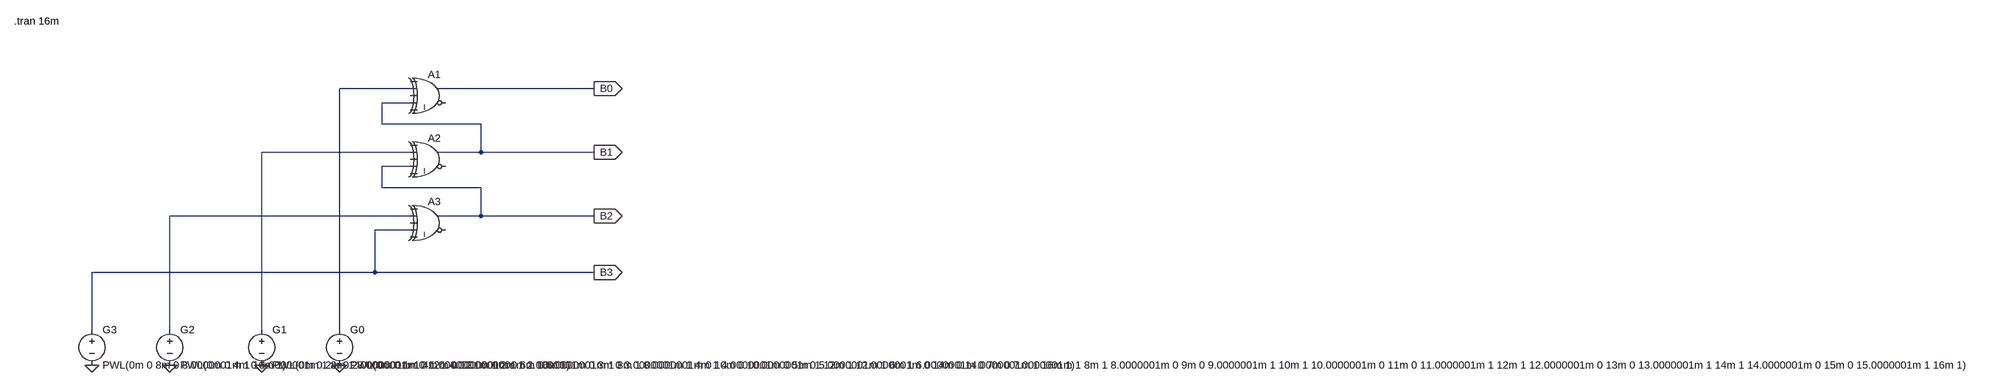
[diagram p0: schematic p42.asc]
p42.asc, the LTspice schematic file:
Version 4.1
SHEET 1 3620 680
WIRE -224 -144 -384 -144
WIRE 192 -144 -160 -144
WIRE -224 -112 -288 -112
WIRE -288 -64 -288 -112
WIRE -64 -64 -288 -64
WIRE -224 0 -560 0
WIRE -64 0 -64 -64
WIRE -64 0 -160 0
WIRE 192 0 -64 0
WIRE -224 32 -288 32
WIRE -288 80 -288 32
WIRE -64 80 -288 80
WIRE -224 144 -768 144
WIRE -64 144 -64 80
WIRE -64 144 -160 144
WIRE 192 144 -64 144
WIRE -224 176 -304 176
WIRE -304 272 -304 176
WIRE -304 272 -944 272
WIRE 192 272 -304 272
WIRE -944 528 -944 272
WIRE -768 528 -768 144
WIRE -560 528 -560 0
WIRE -384 528 -384 -144
FLAG -768 608 0
FLAG -560 608 0
FLAG -384 608 0
FLAG -944 608 0
FLAG 192 272 B3
IOPIN 192 272 Out
FLAG 192 144 B2
IOPIN 192 144 Out
FLAG 192 0 B1
IOPIN 192 0 Out
FLAG 192 -144 B0
IOPIN 192 -144 Out
SYMBOL voltage -944 512 R0
WINDOW 123 0 0 Left 0
WINDOW 39 0 0 Left 0
SYMATTR InstName G3
SYMATTR Value PWL(0m 0 8m 0 8.0000001m 1 16m 1)
SYMBOL voltage -768 512 R0
WINDOW 123 0 0 Left 0
WINDOW 39 0 0 Left 0
SYMATTR InstName G2
SYMATTR Value PWL(0m 0 4m 0 4.0000001m 1 8m 1 8.0000001m 0 12m 0 12.0000001m 1 16m 1)
SYMBOL voltage -560 512 R0
WINDOW 123 0 0 Left 0
WINDOW 39 0 0 Left 0
SYMATTR InstName G1
SYMATTR Value PWL(0m 0 2m 0 2.0000001m 1 4m 1 4.0000001m 0 6m 0 6.0000001m 1 8m 1 8.0000001m 0 10m 0 10.0000001m 1 12m 1 12.0000001m 0 14m 0 14.0000001m 1 16m 1)
SYMBOL voltage -384 512 R0
WINDOW 123 0 0 Left 0
WINDOW 39 0 0 Left 0
SYMATTR InstName G0
SYMATTR Value PWL(0m 0 1m 0 1.0000001m 1 2m 1 2.0000001m 0 3m 0 3.0000001m 1 4m 1 4.0000001m 0 5m 0 5.0000001m 1 6m 1 6.0000001m 0 7m 0 7.0000001m 1 8m 1 8.0000001m 0 9m 0 9.0000001m 1 10m 1 10.0000001m 0 11m 0 11.0000001m 1 12m 1 12.0000001m 0 13m 0 13.0000001m 1 14m 1 14.0000001m 0 15m 0 15.0000001m 1 16m 1)
SYMBOL Digital\\xor -176 -192 R0
SYMATTR InstName A1
SYMBOL Digital\\xor -176 -48 R0
SYMATTR InstName A2
SYMBOL Digital\\xor -176 96 R0
SYMATTR InstName A3
TEXT -1120 -352 Left 2 !.tran 16m

The netlist it stands for:
* p42.asc
V§G3 B3 0 PWL(0m 0 8m 0 8.0000001m 1 16m 1)
V§G2 N003 0 PWL(0m 0 4m 0 4.0000001m 1 8m 1 8.0000001m 0 12m 0 12.0000001m 1 16m 1)
V§G1 N002 0 PWL(0m 0 2m 0 2.0000001m 1 4m 1 4.0000001m 0 6m 0 6.0000001m 1 8m 1 8.0000001m 0 10m 0 10.0000001m 1 12m 1 12.0000001m 0 14m 0 14.0000001m 1 16m 1)
V§G0 N001 0 PWL(0m 0 1m 0 1.0000001m 1 2m 1 2.0000001m 0 3m 0 3.0000001m 1 4m 1 4.0000001m 0 5m 0 5.0000001m 1 6m 1 6.0000001m 0 7m 0 7.0000001m 1 8m 1 8.0000001m 0 9m 0 9.0000001m 1 10m 1 10.0000001m 0 11m 0 11.0000001m 1 12m 1 12.0000001m 0 13m 0 13.0000001m 1 14m 1 14.0000001m 0 15m 0 15.0000001m 1 16m 1)
A1 0 N001 0 B1 0 0 B0 0 XOR
A2 0 N002 0 B2 0 0 B1 0 XOR
A3 0 N003 0 B3 0 0 B2 0 XOR
.tran 16m
.backanno
.end